# Altium schematic sheet Schematic.SchDoc
size A
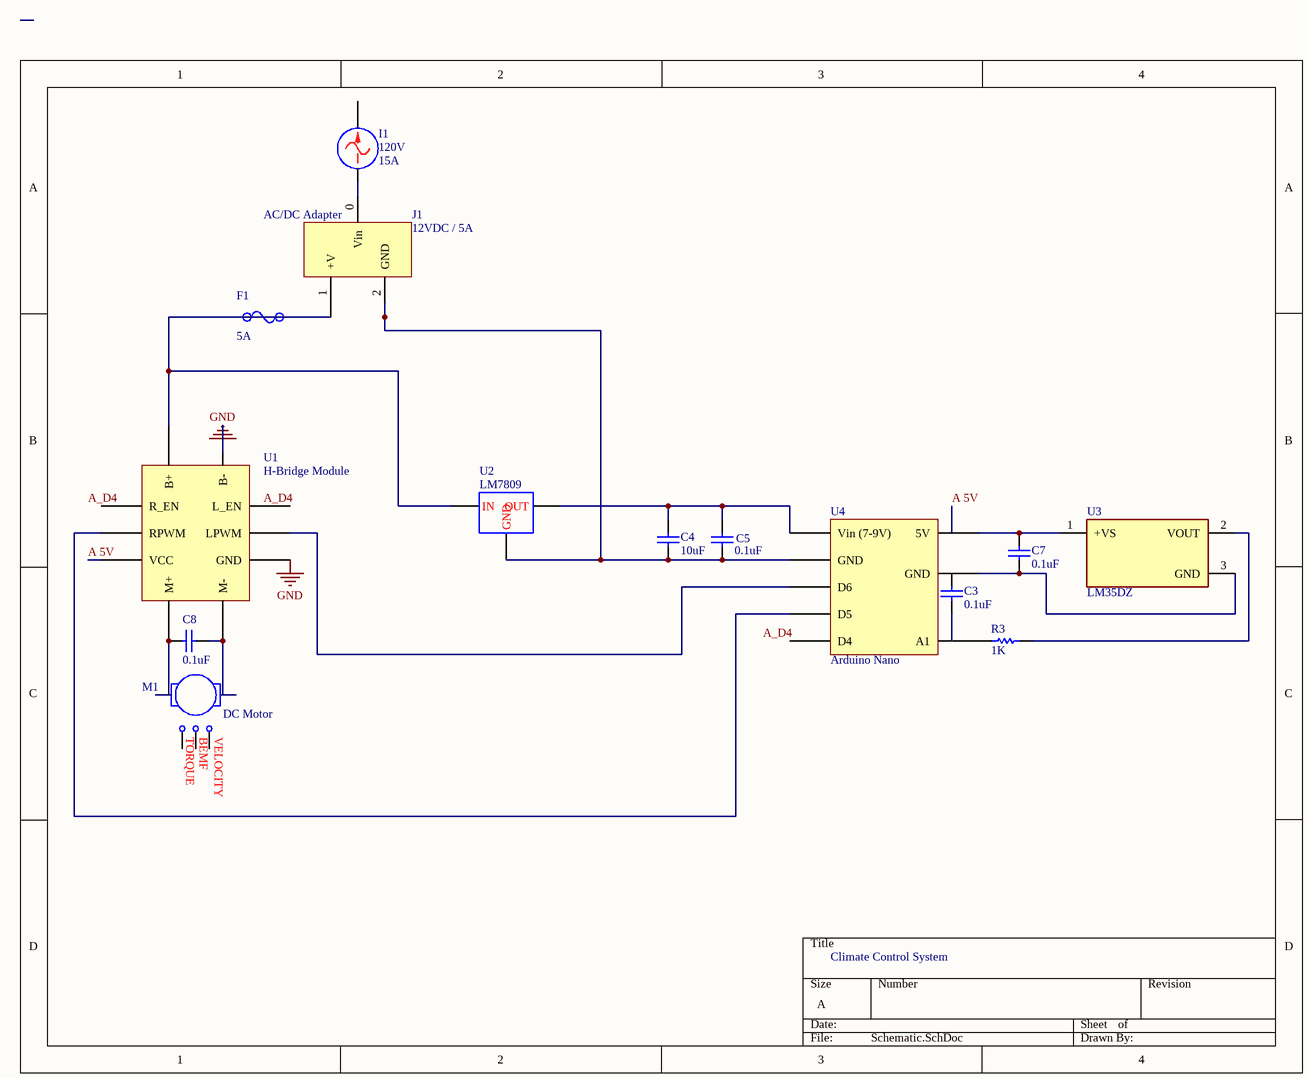
[diagram p0: Schematic.SchDoc]

## Parts
C3  value 0.1uF  (hidden comment: Capacitor)
C4  value 10uF  (hidden comment: Capacitor)
C5  value 0.1uF  (hidden comment: Capacitor)
C7  value 0.1uF  (hidden comment: Capacitor)
C8  value 0.1uF  (hidden comment: Capacitor)
F1  5A  [FP-0297004_U-MFG]
I1  Wall Outlet: 120V  Amp: 15A  (hidden comment: AC Current Source)
J1  12VDC / 5A
M1  DC Motor
R3  value 1K  (hidden comment: Resistor)
U1  H-Bridge Module
U2  Positive Fixed Voltage regulator  (value not drawn)
U3  LM35DZ  [FP-LP0003A-MFG]
U4  Arduino Nano

## Nets
GND: U1.8(GND) U1.10(B-)
A 5V: U1.7(VCC)
NetC4_1: C4.1 C5.1 U2.3(OUT) U4.13(Vin_(7-9V))
NetC4_2: C4.2 C5.2 J1.2(GND) U2.2(GND) U4.14(GND)
NetC7_1: C7.1 U3.3(GND) U4.19(GND)
NetC7_2: C7.2 U3.1(+VS) U4.13(5V)
NetC8_1: C8.1 M1.2 U1.11(M+)
NetC8_2: C8.2 M1.1 U1.12(M-)
NetI1_2: I1.2 J1.0(Vin)
NetJ1_1: J1.1(+V) U1.9(B+) U2.1(IN)
NetR3_1: R3.1 U4.18(A1)
NetR3_2: R3.2 U3.2(VOUT)
NetU1_5: U1.5(RPWM) U4.16(D5)
NetU1_6: U1.6(LPWM) U4.15(D6)

Not connected (* = marked no-connect by the designer): C3 1 2; I1 1; M1 3 4 5; U1 3(R_EN) 4(L_EN); U4 20(D4)

## Notes on the sheet
- (near U2) LM7809
- Climate Control System
- Labels drawn without touching a wire or pin: A_D4
- (in symbol DC Motor) TORQUE; BEMF; VELOCITY

## Library data of the parts
C3 = Capacitor: 1/0.1uF; SimulationGenericComponent: True
C4 C5 C7 C8 = Capacitor: SimulationGenericComponent: True
F1 = CMP-00227-23028987-1: 0297004.U Fuse Blade Fast Acting 4A 32V Socket 10.9 X 3.8 X 8.8mm Polyamide 66 Automotive UL; Color: Pink; Resistance: 23.48mΩ; Schedule B: 8536100040; Depth: 3.8mm; Voltage Rating (DC): 32V; Housing Material: Polyamide; Min Operating Temperature: -40°C; Fuse Current: 4A; RoHS: Compliant; NexarPartId: 23028987; Mount: Holder, Socket; Lead Free: Lead Free; Height: 8.8mm; Max Operating Temperature: 125°C; Current Rating: 4A; Voltage Rating: 32V; Packaging: Bulk; Width: 3.81mm; Approvals: UL; Length: 10.9mm
I1 = AC Current Source: SimulationGenericComponent: True; DC: 0; Phase: 0
J1 = AC/DC Adapter: AC/DC Adapter, DC-Jack-2.5mm
M1 = DC Motor: RA: 0.5; KE: 0.05; JM: 250U; BM: 0.1M; TL: 0; SimulationGenericComponent: True; KT: 0.05
R3 = Resistor: TC1: 0; SimulationGenericComponent: True; TC2: 0
U1 = H-Bridge Module: BTS7960 H-bridge module / IBT-2
U2 = Linear Voltage Regulator (Fixed): Positive Fixed Voltage regulator 12V --> 9V; Av_feedback: 1665; R1_Value: 1020; SimulationGenericComponent: True
U3 = CMP-04948-000072-1: SENSOR ANALOG 0C-100C TO92-3; Output Current: 10mA; Max Supply Voltage (DC): 30V; Min Supply Voltage: 4V; Quiescent Current: 56uA; Nominal Supply Current: 82A; Length: 5.21mm; Min Operating Temperature: -40°C; Interface: Analog; Number of Pins: 3; Package Quantity: 2000; Max Operating Temperature: 110°C; Case/Package: TO-92; Radiation Hardening: No; Packaging: Tape and Reel; REACH SVHC: No SVHC; Lead Free: Lead Free; Output Type: Analog; Mount: Through Hole; Height: 5.34mm; Min Supply Voltage (DC): 4V; Width: 4.19mm; Series: LM35; Max Supply Voltage: 30V